# Altium project VCO_RAW.PrjPcb
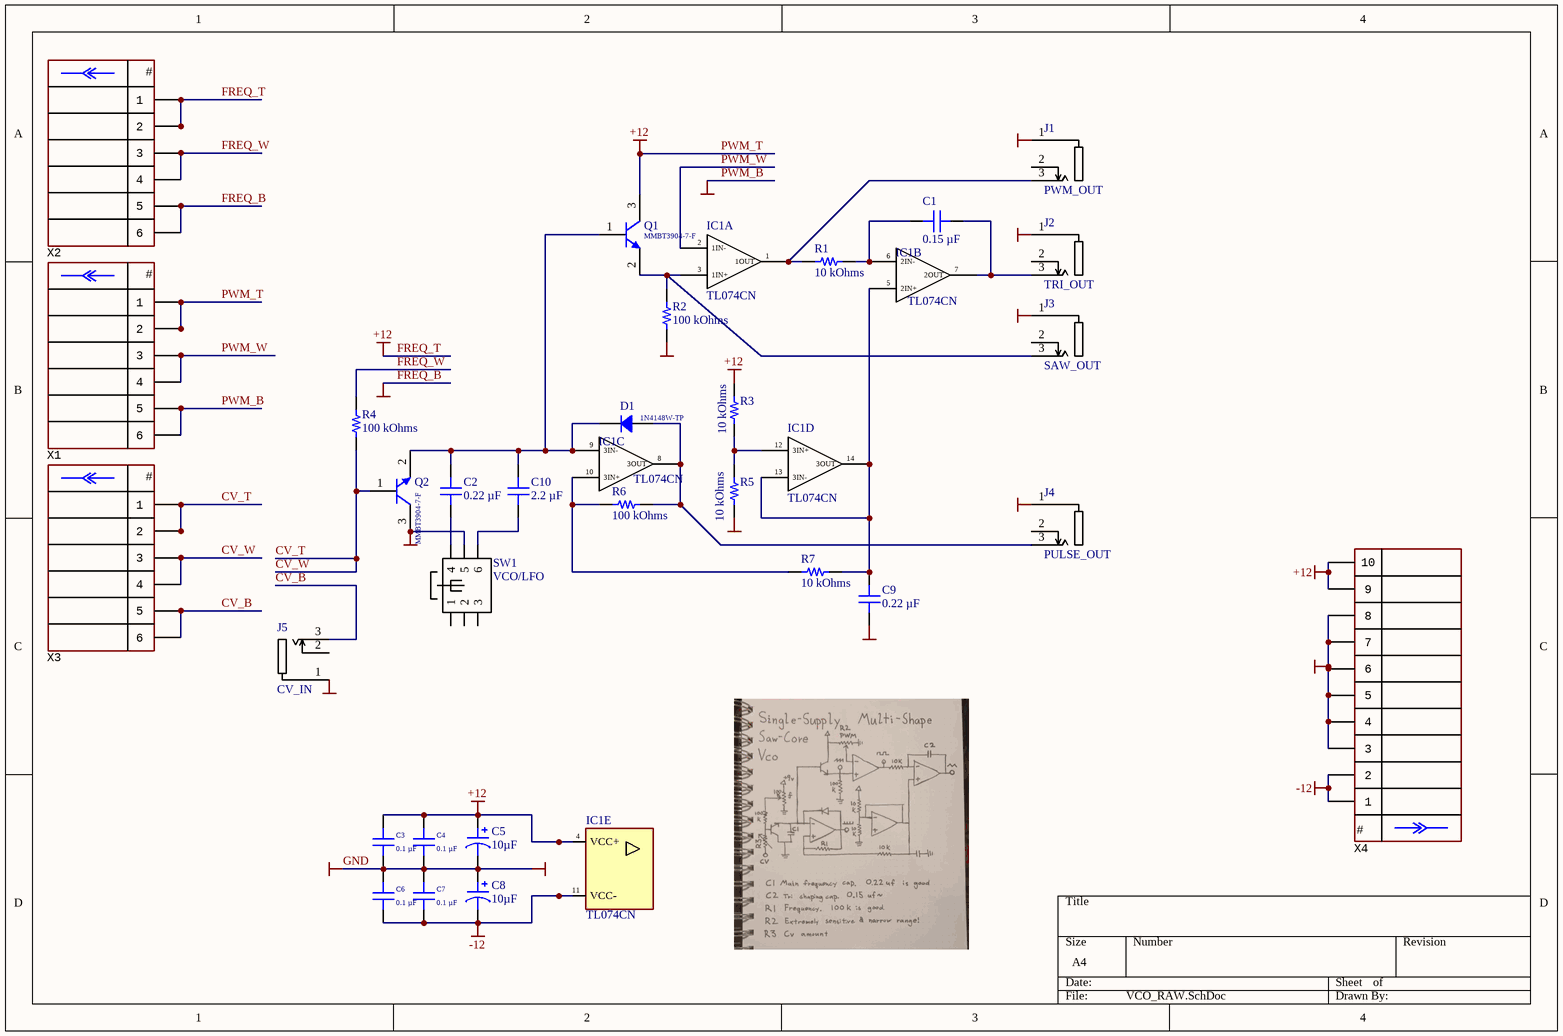
[diagram p0: VCO_RAW.SchDoc]
1 sheet, 31 parts. Net scope: global (net labels, ports and power ports of the same name join across sheets).
Board files: VCO_RAW.PcbDoc, VCO_RAW_Front.PcbDoc

## Sheet VCO_RAW.SchDoc
size A4; SheetNumber: 1; SheetTotal: 1

### Parts
C1  0.15 µF  [MURATA GCM188 0603_1608]
C2  0.22 µF  [CAP 0603_1608]
C3  0.1 µF  [CAP 0603_1608]
C4  0.1 µF  [CAP 0603_1608]
C5  10µF  [CAP POL 1411_3528]
C6  0.1 µF  [CAP 0603_1608]
C7  0.1 µF  [CAP 0603_1608]
C8  10µF  [CAP POL 1411_3528]
C9  0.22 µF  [CAP 0603_1608]
C10  2.2 µF  [MURATA GRM188 0603_1608]
D1  1N4148W-TP  [SOD-123]
IC1  TL074CN  [DIP_SMD-14]  (parts A,B,C,D,E of 5)
J1  PWM_OUT  [THONKICONN]
J2  TRI_OUT  [THONKICONN]
J3  SAW_OUT  [THONKICONN]
J4  PULSE_OUT  [THONKICONN]
J5  CV_IN  [THONKICONN]
Q1  MMBT3904-7-F  [DIODES SOT-23-3]
Q2  MMBT3904-7-F  [DIODES SOT-23-3]
R1  10 kOhms  [YAGEO RES 0603_1608]
R2  100 kOhms  [YAGEO RES 0603_1608]
R3  10 kOhms  [YAGEO RES 0603_1608]
R4  100 kOhms  [YAGEO RES 0603_1608]
R5  10 kOhms  [YAGEO RES 0603_1608]
R6  100 kOhms  [YAGEO RES 0603_1608]
R7  10 kOhms  [YAGEO RES 0603_1608]
SW1  VCO/LFO  [PB_SW_LATCH]
X1  (no value)  [CON: PBD-6]
X2  (no value)  [CON: PBD-6]
X3  (no value)  [CON: PBD-6]
X4  (no value)  [CON: IDC-10MS]

### Nets
-12: C6.1 C7.1 C8.2 IC1.11(VCC-) X4.1 X4.2
FREQ_B: C3.1 C4.1 C5.2 C6.2 C7.2 C8.1 C9.1 J1.1 J2.1 J3.1 J4.1 J5.1 Q2.3(C) R2.1 R5.1 SW1.5 X1.5 X1.6 X2.5 X2.6 X4.3 X4.4 X4.5 X4.6 X4.7 X4.8  [also labelled GND, PWM_B]
FREQ_T: C3.2 C4.2 C5.1 IC1.4(VCC+) Q1.3(C) R3.2 X1.1 X1.2 X2.1 X2.2 X4.9 X4.10  [also labelled +12, PWM_T]
CV_B: J5.3 X3.5 X3.6
CV_T: Q2.1(B) R4.1 X3.1 X3.2 X3.3 X3.4  [also labelled CV_W]
FREQ_W: R4.2 X2.3 X2.4
PWM_W: IC1.2(1IN-) X1.3 X1.4
NetC1_1: C1.1 IC1.6(2IN-) R1.2
NetC1_2: C1.2 IC1.7(2OUT) J2.3
NetC2_1: C2.1 SW1.4
NetC2_2: C2.2 C10.2 D1.2 IC1.9(3IN-) Q1.1(B) Q2.2(E)
NetC9_2: C9.2 IC1.5(2IN+) IC1.13(3IN-) IC1.14(3OUT) R7.1
NetC10_1: C10.1 SW1.6
NetD1_1: D1.1 IC1.8(3OUT) J4.3 R6.1
NetIC1_1: IC1.1(1OUT) J1.3 R1.1
NetIC1_3: IC1.3(1IN+) J3.3 Q1.2(E) R2.2
NetIC1_10: IC1.10(3IN+) R6.2 R7.2
NetIC1_12: IC1.12(3IN+) R3.1 R5.2

Not connected (* = marked no-connect by the designer): J1 2(4); J2 2(4); J3 2(4); J4 2(4); J5 2(4); SW1 1 2 3

### Notes on the sheet
- (in symbol IDC-10) #
- (in symbol PBD-6) #

### Library data of the parts
C1 = GCM188R71H154KA64D: CAP CER 0.15UF 50V X7R 0603; manufacturer: Murata Electronics; Tolerance: ±10%; Part Number: GCM188R71H154KA64D; Capacitance: 0.15 µF; Applications: Automotive; componentlink1description: Datasheet; componentlink1url: https://www.murata.com/~/media/webrenewal/support/library/catalog/products/capacitor/mlcc/c03e.ashx?la=en-us; componentlink2description: DigiKey Link; componentlink2url: https://www.digikey.com/en/products/detail/murata-electronics/GCM188R71H154KA64D/4903958; Device Package: 0603 (1608 Metric); lastupdated: 7/20/2024 12:25:02 AM; Lifecycle Status: Active; Minimum Order: 1; Mounting Type: Surface Mount, MLCC; Operating Temperature: -55°C ~ 125°C; Package / Case: 0603 (1608 Metric); packaging: TapeAndReel; partid: 6776; Part Status: Active; price: 0.02; Ratings: AEC-Q200; series: GCM; Size / Dimension: 0.063" L x 0.031" W (1.60mm x 0.80mm); Supplier 1: DigiKey; Supplier Part Number 1: 490-11960-1-ND; Temperature Coefficient: X7R; Thickness (Max): 0.035" (0.90mm); value: 0.15 µF; Voltage - Rated: 50V
C2 C9 = CC0603KRX7R9BB224: CAP CER 0.22UF 50V X7R 0603; manufacturer: Yageo; Tolerance: ±10%; Part Number: CC0603KRX7R9BB224; Capacitance: 0.22 µF; Applications: General Purpose; componentlink1description: Datasheet; componentlink1url: https://www.yageo.com/upload/media/product/productsearch/datasheet/mlcc/UPY-GPHC_X7R_6.3V-to-50V_18.pdf; componentlink2description: DigiKey Link; componentlink2url: https://www.digikey.com/en/products/detail/yageo/CC0603KRX7R9BB224/5883804; Device Package: 0603 (1608 Metric); lastupdated: 2/9/2024 8:10:26 PM; Lifecycle Status: Active; Minimum Order: 1; Mounting Type: Surface Mount, MLCC; Operating Temperature: -55°C ~ 125°C; Package / Case: 0603 (1608 Metric); packaging: TapeAndReel; partid: 5406; Part Status: Active; price: 0.04; series: CC; Size / Dimension: 0.063" L x 0.031" W (1.60mm x 0.80mm); Supplier 1: DigiKey; Supplier Part Number 1: 311-3374-1-ND; Temperature Coefficient: X7R; Thickness (Max): 0.035" (0.90mm); value: 0.22 µF; Voltage - Rated: 50V
C3 C4 C6 C7 = C0603C104K5RAC7411: CAP CER 0.1UF 50V X7R 0603; manufacturer: KEMET; Tolerance: ±10%; Part Number: C0603C104K5RAC7411; Value: 0.1 µF; Applications: Bypass, Decoupling; Capacitance: 0.1 µF; componentlink1description: Datasheet; componentlink1url: https://api.kemet.com/component-edge/download/datasheet/C0603C104K5RAC7411.pdf; componentlink2description: DigiKey Link; componentlink2url: https://www.digikey.com/en/products/detail/kemet/C0603C104K5RAC7411/3317013; Device Package: 0603 (1608 Metric); lastupdated: 2/9/2024 8:10:30 PM; Lifecycle Status: Active; Minimum Order: 1; Mounting Type: Surface Mount, MLCC; Operating Temperature: -55°C ~ 125°C; Package / Case: 0603 (1608 Metric); packaging: TapeAndReel; partid: 2233; Part Status: Active; price: 0.01; series: SMD Comm X7R; Size / Dimension: 0.063" L x 0.031" W (1.60mm x 0.80mm); Supplier 1: DigiKey; Supplier Part Number 1: 399-C0603C104K5RAC7411CT-ND; Temperature Coefficient: X7R; Thickness (Max): 0.035" (0.90mm); Voltage - Rated: 50V
C5 C8 = TAJB106K025RNJ: CAP TANT 10UF 10% 25V 1411; manufacturer: AVX Corporation; Manufacturer Size Code: B; ESR (Equivalent Series Resistance): 2.5Ohm; Type: Molded; Part Number: TAJB106K025RNJ; Value: 10µF; Capacitance: 10µF; componentlink1description: Datasheet; componentlink1url: http://datasheets.avx.com/TAJ.pdf; componentlink2description: DigiKey Link; componentlink2url: http://digikey.com/product-detail/en/avx-corporation/TAJB106K025RNJ/478-5257-1-ND/1950924; Features: General Purpose; Height - Seated (Max): 0.083" (2.10mm); lastupdated: 9/2/2020 1:15:45 AM; Lifecycle Status: Active; Minimum Order: 1; Mounting Type: Surface Mount; Operating Temperature: -55°C ~ 125°C; Package / Case: 1411 (3528 Metric), 1210; packaging: TapeAndReel; partid: 206; Part Status: Active; price: 0.16; series: TAJ; Size / Dimension: 0.138" L x 0.110" W (3.50mm x 2.80mm); Supplier 1: DigiKey; Supplier Part Number 1: 478-5257-1-ND; Tolerance: ±10%; Voltage - Rated: 25V
C10 = GRM188R61H225ME11D: CAP CER 2.2UF 50V X5R 0603; manufacturer: Murata Electronics; Tolerance: ±20%; Part Number: GRM188R61H225ME11D; Capacitance: 2.2 µF; Applications: General Purpose; componentlink1description: Datasheet; componentlink1url: https://search.murata.co.jp/Ceramy/image/img/A01X/G101/ENG/GRM188R61H225ME11-01.pdf; componentlink2description: DigiKey Link; componentlink2url: https://www.digikey.com/en/products/detail/murata-electronics/GRM188R61H225ME11D/4905365; Device Package: 0603 (1608 Metric); lastupdated: 7/20/2024 12:23:20 AM; Lifecycle Status: Active; Minimum Order: 1; Mounting Type: Surface Mount, MLCC; Operating Temperature: -55°C ~ 85°C; Package / Case: 0603 (1608 Metric); packaging: TapeAndReel; partid: 12610; Part Status: Active; price: 0.03; series: GRM; Size / Dimension: 0.063" L x 0.031" W (1.60mm x 0.80mm); Supplier 1: DigiKey; Supplier Part Number 1: 490-12740-1-ND; Temperature Coefficient: X5R; Thickness (Max): 0.039" (1.00mm); value: 2.2 µF; Voltage - Rated: 50V
D1 = 1N4148W-TP: DIODE GEN PURP 100V 150MA SOD123; Manufacturer: Micro Commercial Co; Capacitance @ Vr, F: 2pF @ 0V, 1MHz; Current - Reverse Leakage @ Vr: 1 µA @ 75 V; Diode Type: Standard; Reverse Recovery Time (trr): 4 ns; Speed: Small Signal =< 200mA (Io), Any Speed; Voltage - Forward (Vf) (Max) @ If: 1.25 V @ 150 mA; Part Number: 1N4148W-TP; ComponentLink1Description: Datasheet; ComponentLink1URL: https://www.mccsemi.com/pdf/Products/1N4148W(SOD123).pdf; ComponentLink2Description: DigiKey Link; ComponentLink2URL: https://www.digikey.com/en/products/detail/micro-commercial-co/1N4148W-TP/717196; Current - Average Rectified (Io): 150mA; LastUpdated: 6/3/2024 7:54:46 PM; Lifecycle Status: Active; Minimum Order: 1; Mounting Type: Surface Mount; Operating Temperature - Junction: -65°C ~ 150°C; Package / Case: SOD-123; Packaging: TapeAndReel; PartId: 999; Part Status: Active; Price: 0.01; Series: -; Supplier 1: DigiKey; Supplier Part Number 1: 1N4148WTPMSCT-ND; Supplier Device Package: SOD-123; Voltage - DC Reverse (Vr) (Max): 100 V
IC1 = TL074CN: Integrated Circuit; Manufacturer_Name: Texas Instruments; Datasheet Link: https://www.ti.com/lit/ds/symlink/tl074.pdf?HQS=TI-null-null-mousermode-df-pf-null-wwe&ts=1598513500878&ref_url=https%253A%252F%252Feu.mouser.com%252F; Height: 5.08mm; Manufacturer_Part_Number: TL074CN; Mouser Part Number: 595-TL074CN; Mouser Price/Stock: https://www.mouser.co.uk/ProductDetail/Texas-Instruments/TL074CN?qs=AMJt07B76uv7dLYnj7iLiQ%3D%3D; Arrow Part Number: TL074CN; Arrow Price/Stock: https://www.arrow.com/en/products/tl074cn/texas-instruments?utm_currency=USD&region=nac
J1-J5 = PJ-301M-3P: THONKICONN metal
Q1 Q2 = MMBT3904-7-F: TRANS NPN 40V 0.2A SOT23-3; Manufacturer: Diodes Incorporated; Current - Collector Cutoff (Max): 50nA (ICBO); Current - Collector (Ic) (Max): 200 mA; DC Current Gain (hFE) (Min) @ Ic, Vce: 100 @ 10mA, 1V; Frequency - Transition: 300MHz; Power - Max: 300 mW; Vce Saturation (Max) @ Ib, Ic: 300mV @ 5mA, 50mA; Part Number: MMBT3904-7-F; ComponentLink1Description: Datasheet; ComponentLink1URL: https://www.diodes.com/assets/Datasheets/ds30036.pdf; ComponentLink2Description: DigiKey Link; ComponentLink2URL: https://www.digikey.com/en/products/detail/diodes-incorporated/MMBT3904-7-F/814494; LastUpdated: 2/8/2024 9:54:04 PM; Lifecycle Status: Active; Minimum Order: 1; Mounting Type: Surface Mount; Operating Temperature: -55°C ~ 150°C (TJ); Package / Case: TO-236-3, SC-59, SOT-23-3; Packaging: TapeAndReel; PartId: 85; Part Status: Active; Price: 0.01; Series: -; Supplier 1: DigiKey; Supplier Part Number 1: MMBT3904-FDICT-ND; Supplier Device Package: SOT-23-3; Transistor Type: NPN; Voltage - Collector Emitter Breakdown (Max): 40 V
R1 R3 R5 R7 = AA0603FR-0710KL: RES SMD 10K OHM 1% 1/10W 0603; Manufacturer: Yageo; Power (Watts): 0.1W, 1/10W; Temperature Coefficient: ±150ppm/°C; Part Number: AA0603FR-0710KL; Value: 10 kOhms; ComponentLink1Description: Datasheet; ComponentLink1URL: https://www.yageo.com/upload/media/product/productsearch/datasheet/rchip/PYu-AA_51_RoHS_L_3.pdf; ComponentLink2Description: DigiKey Link; ComponentLink2URL: https://www.digikey.com/en/products/detail/yageo/AA0603FR-0710KL/5888698; Composition: Thick Film; Device Package: 0603 (1608 Metric); Features: Anti-Sulfur, Automotive AEC-Q200, Moisture Resistant; Height - Seated (Max): 0.022" (0.55mm); LastUpdated: 7/25/2024 9:19:15 AM; Lifecycle Status: Active; Minimum Order: 1; Number of Terminations: 2; Operating Temperature: -55°C ~ 155°C; Package / Case: 0603 (1608 Metric); Packaging: TapeAndReel; PartId: 64302; Part Status: Active; Price: 0.01; Ratings: AEC-Q200; Resistance: 10 kOhms; Series: AA; Size / Dimension: 0.063" L x 0.031" W (1.60mm x 0.80mm); Supplier 1: DigiKey; Supplier Part Number 1: 13-AA0603FR-0710KLCT-ND; Supplier Device Package: 0603; Tolerance: ±1%
R2 R4 R6 = AA0603FR-07100KL: RES SMD 100K OHM 1% 1/10W 0603; Manufacturer: Yageo; Power (Watts): 0.1W, 1/10W; Temperature Coefficient: ±150ppm/°C; Part Number: AA0603FR-07100KL; Value: 100 kOhms; ComponentLink1Description: Datasheet; ComponentLink1URL: https://www.yageo.com/upload/media/product/productsearch/datasheet/rchip/PYu-AA_51_RoHS_L_3.pdf; ComponentLink2Description: DigiKey Link; ComponentLink2URL: https://www.digikey.com/en/products/detail/yageo/AA0603FR-07100KL/5888687; Composition: Thick Film; Device Package: 0603 (1608 Metric); Features: Anti-Sulfur, Automotive AEC-Q200, Moisture Resistant; Height - Seated (Max): 0.022" (0.55mm); LastUpdated: 7/25/2024 9:19:03 AM; Lifecycle Status: Active; Minimum Order: 1; Number of Terminations: 2; Operating Temperature: -55°C ~ 155°C; Package / Case: 0603 (1608 Metric); Packaging: TapeAndReel; PartId: 78895; Price: 0.01; Ratings: AEC-Q200; Resistance: 100 kOhms; Series: AA; Size / Dimension: 0.063" L x 0.031" W (1.60mm x 0.80mm); Supplier 1: DigiKey; Supplier Part Number 1: 13-AA0603FR-07100KLCT-ND; Supplier Device Package: 0603; Tolerance: ±1%
SW1 = Push_SW_DPDT
X1-X3 = PBD-6: Manufacturer: Connfly; ValueManufacturerPartNumber: Connector, 6pin, 2.54mm, 500VAC, 3A; TypeConnector: Connector; VoltageMax: 500VAC; Pitch: 2.54mm; CurrentMax: 3A; Multichannel: 6pin; CommentText: "Разъем"; HelpURL: https://www.chipdip.ru/product/pbd-6; PartNumber: PBD-6
X4 = IDC-10: Manufacturer: Connfly; ValueManufacturerPartNumber: Connector, 10pin, 2.54mm, 250VAC, 3A; TypeConnector: Connector; VoltageMax: 250VAC; Pitch: 2.54mm; CurrentMax: 3A; Multichannel: 10pin; CommentText: "Разъем"; HelpURL: https://www.chipdip.ru/product/idc-10ms; PartNumber: IDC-10